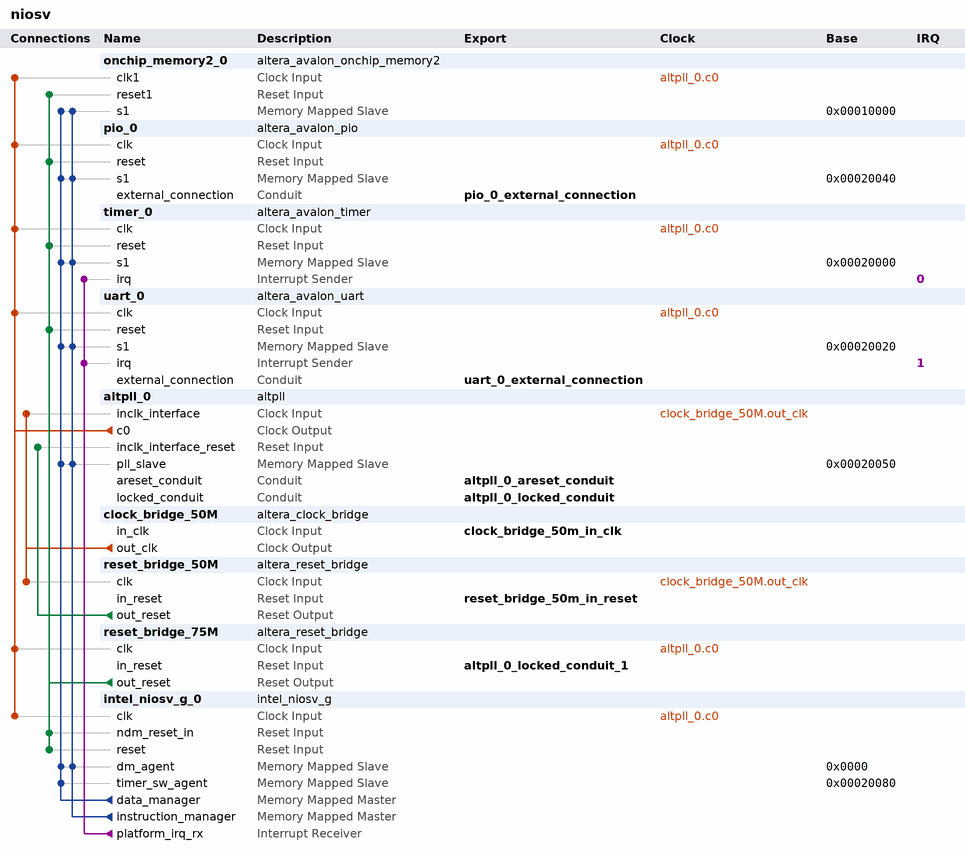
[diagram p0: system contents]
# Platform Designer (Qsys) system niosv, Cyclone 10 LP 10CL025YU256I7G
# Parameters at their usual value, and those the tool derives, are not listed.
package require -exact qsys 25.1
create_system niosv
set_project_property DEVICE_FAMILY {Cyclone 10 LP}
set_project_property DEVICE 10CL025YU256I7G

add_instance onchip_memory2_0 altera_avalon_onchip_memory2 25.1
set_instance_parameter_value onchip_memory2_0 dataWidth 32
set_instance_parameter_value onchip_memory2_0 dualPort false
set_instance_parameter_value onchip_memory2_0 initMemContent true
set_instance_parameter_value onchip_memory2_0 initializationFileName onchip_mem.hex
set_instance_parameter_value onchip_memory2_0 memorySize 38000
set_instance_parameter_value onchip_memory2_0 resetrequest_enabled false

add_instance pio_0 altera_avalon_pio 25.1
set_instance_parameter_value pio_0 direction Output
set_instance_parameter_value pio_0 width 4

add_instance timer_0 altera_avalon_timer 25.1
set_instance_parameter_value timer_0 period 100
set_instance_parameter_value timer_0 periodUnits MSEC

add_instance uart_0 altera_avalon_uart 25.1
set_instance_parameter_value uart_0 baud 115200
set_instance_parameter_value uart_0 dataBits 8
set_instance_parameter_value uart_0 fixedBaud true
set_instance_parameter_value uart_0 parity NONE
set_instance_parameter_value uart_0 stopBits 1

add_instance altpll_0 altpll 25.1
set_instance_parameter_value altpll_0 CLK0_DIVIDE_BY 2
set_instance_parameter_value altpll_0 CLK0_MULTIPLY_BY 3
set_instance_parameter_value altpll_0 CLK1_DIVIDE_BY 2
set_instance_parameter_value altpll_0 CLK1_DUTY_CYCLE 50
set_instance_parameter_value altpll_0 CLK1_MULTIPLY_BY 3
set_instance_parameter_value altpll_0 CLK1_PHASE_SHIFT 0
set_instance_parameter_value altpll_0 INCLK0_INPUT_FREQUENCY 20000
set_instance_parameter_value altpll_0 PORT_ARESET PORT_USED
set_instance_parameter_value altpll_0 PORT_LOCKED PORT_USED
set_instance_parameter_value altpll_0 PORT_clk1 PORT_USED
set_instance_parameter_value altpll_0 PORT_clk2 PORT_UNUSED
set_instance_parameter_value altpll_0 PORT_clk3 PORT_UNUSED

add_instance clock_bridge_50M altera_clock_bridge 25.1
set_instance_parameter_value clock_bridge_50M DERIVED_CLOCK_RATE 0
set_instance_parameter_value clock_bridge_50M EXPLICIT_CLOCK_RATE 50000000

add_instance reset_bridge_50M altera_reset_bridge 25.1
set_instance_parameter_value reset_bridge_50M ACTIVE_LOW_RESET 1
set_instance_parameter_value reset_bridge_50M SYNCHRONOUS_EDGES deassert

add_instance reset_bridge_75M altera_reset_bridge 25.1
set_instance_parameter_value reset_bridge_75M ACTIVE_LOW_RESET 1
set_instance_parameter_value reset_bridge_75M SYNCHRONOUS_EDGES deassert

add_instance intel_niosv_g_0 intel_niosv_g 4.0.0
set_instance_parameter_value intel_niosv_g_0 Blind_Window_Period 1000
set_instance_parameter_value intel_niosv_g_0 CLICenabledInterruptMode 0
set_instance_parameter_value intel_niosv_g_0 CLICenabledShadowRegisterFiles 1
set_instance_parameter_value intel_niosv_g_0 Default_Timeout_Period 255
set_instance_parameter_value intel_niosv_g_0 alignCLICVectorTable 8
set_instance_parameter_value intel_niosv_g_0 basicInterruptMode 0
set_instance_parameter_value intel_niosv_g_0 basicShadowRegisterFiles 0
set_instance_parameter_value intel_niosv_g_0 clockFrequency 75000000
set_instance_parameter_value intel_niosv_g_0 dataCacheSize 4096
set_instance_parameter_value intel_niosv_g_0 disableFsqrtFdiv false
set_instance_parameter_value intel_niosv_g_0 dtcm1Base 0
set_instance_parameter_value intel_niosv_g_0 dtcm1Size 0
set_instance_parameter_value intel_niosv_g_0 dtcm2Base 0
set_instance_parameter_value intel_niosv_g_0 dtcm2Size 0
set_instance_parameter_value intel_niosv_g_0 enableBranchPrediction true
set_instance_parameter_value intel_niosv_g_0 enableCLICInterruptEdgeTriggerConfig false
set_instance_parameter_value intel_niosv_g_0 enableCLICInterruptPolarityConfig false
set_instance_parameter_value intel_niosv_g_0 enableCLICSelectiveHardwareVectoring false
set_instance_parameter_value intel_niosv_g_0 enableCoreLevelInterruptController false
set_instance_parameter_value intel_niosv_g_0 enableDebug true
set_instance_parameter_value intel_niosv_g_0 enableDebugReset true
set_instance_parameter_value intel_niosv_g_0 enableECCFull false
set_instance_parameter_value intel_niosv_g_0 enableECCLite false
set_instance_parameter_value intel_niosv_g_0 enableFPU false
set_instance_parameter_value intel_niosv_g_0 enableLockstep false
set_instance_parameter_value intel_niosv_g_0 enableLockstepExtRst false
set_instance_parameter_value intel_niosv_g_0 enableMulDiv true
set_instance_parameter_value intel_niosv_g_0 hartId 0
set_instance_parameter_value intel_niosv_g_0 instCacheSize 4096
set_instance_parameter_value intel_niosv_g_0 itcm1Base 0
set_instance_parameter_value intel_niosv_g_0 itcm1Size 0
set_instance_parameter_value intel_niosv_g_0 itcm2Base 0
set_instance_parameter_value intel_niosv_g_0 itcm2Size 0
set_instance_parameter_value intel_niosv_g_0 numCLICDebugTriggers 0
set_instance_parameter_value intel_niosv_g_0 numCLICLevels 2
set_instance_parameter_value intel_niosv_g_0 numCLICPlatformInterrupts 16
set_instance_parameter_value intel_niosv_g_0 numCLICPriorities 8
set_instance_parameter_value intel_niosv_g_0 peripheralRegionABase 131072
set_instance_parameter_value intel_niosv_g_0 peripheralRegionASize 65536
set_instance_parameter_value intel_niosv_g_0 peripheralRegionBBase 0
set_instance_parameter_value intel_niosv_g_0 peripheralRegionBSize 0
set_instance_parameter_value intel_niosv_g_0 resetOffset 0
set_instance_parameter_value intel_niosv_g_0 resetSlave onchip_memory2_0.s1
set_instance_parameter_value intel_niosv_g_0 useResetReq false

# connections
add_connection altpll_0.c0 intel_niosv_g_0.clk clock
add_connection altpll_0.c0 onchip_memory2_0.clk1 clock
add_connection altpll_0.c0 pio_0.clk clock
add_connection altpll_0.c0 reset_bridge_75M.clk clock
add_connection altpll_0.c0 timer_0.clk clock
add_connection altpll_0.c0 uart_0.clk clock
add_connection clock_bridge_50M.out_clk altpll_0.inclk_interface clock
add_connection clock_bridge_50M.out_clk reset_bridge_50M.clk clock
add_connection reset_bridge_50M.out_reset altpll_0.inclk_interface_reset reset
add_connection reset_bridge_75M.out_reset intel_niosv_g_0.ndm_reset_in reset
add_connection reset_bridge_75M.out_reset intel_niosv_g_0.reset reset
add_connection reset_bridge_75M.out_reset onchip_memory2_0.reset1 reset
add_connection reset_bridge_75M.out_reset pio_0.reset reset
add_connection reset_bridge_75M.out_reset timer_0.reset reset
add_connection reset_bridge_75M.out_reset uart_0.reset reset
add_connection intel_niosv_g_0.data_manager altpll_0.pll_slave avalon
set_connection_parameter_value intel_niosv_g_0.data_manager/altpll_0.pll_slave baseAddress 0x00020050
add_connection intel_niosv_g_0.data_manager intel_niosv_g_0.dm_agent avalon
set_connection_parameter_value intel_niosv_g_0.data_manager/intel_niosv_g_0.dm_agent baseAddress 0x0000
add_connection intel_niosv_g_0.data_manager intel_niosv_g_0.timer_sw_agent avalon
set_connection_parameter_value intel_niosv_g_0.data_manager/intel_niosv_g_0.timer_sw_agent baseAddress 0x00020080
add_connection intel_niosv_g_0.data_manager onchip_memory2_0.s1 avalon
set_connection_parameter_value intel_niosv_g_0.data_manager/onchip_memory2_0.s1 baseAddress 0x00010000
add_connection intel_niosv_g_0.data_manager pio_0.s1 avalon
set_connection_parameter_value intel_niosv_g_0.data_manager/pio_0.s1 baseAddress 0x00020040
add_connection intel_niosv_g_0.data_manager timer_0.s1 avalon
set_connection_parameter_value intel_niosv_g_0.data_manager/timer_0.s1 baseAddress 0x00020000
add_connection intel_niosv_g_0.data_manager uart_0.s1 avalon
set_connection_parameter_value intel_niosv_g_0.data_manager/uart_0.s1 baseAddress 0x00020020
add_connection intel_niosv_g_0.instruction_manager altpll_0.pll_slave avalon
set_connection_parameter_value intel_niosv_g_0.instruction_manager/altpll_0.pll_slave baseAddress 0x00020050
add_connection intel_niosv_g_0.instruction_manager intel_niosv_g_0.dm_agent avalon
set_connection_parameter_value intel_niosv_g_0.instruction_manager/intel_niosv_g_0.dm_agent baseAddress 0x0000
add_connection intel_niosv_g_0.instruction_manager onchip_memory2_0.s1 avalon
set_connection_parameter_value intel_niosv_g_0.instruction_manager/onchip_memory2_0.s1 baseAddress 0x00010000
add_connection intel_niosv_g_0.instruction_manager pio_0.s1 avalon
set_connection_parameter_value intel_niosv_g_0.instruction_manager/pio_0.s1 baseAddress 0x00020040
add_connection intel_niosv_g_0.instruction_manager timer_0.s1 avalon
set_connection_parameter_value intel_niosv_g_0.instruction_manager/timer_0.s1 baseAddress 0x00020000
add_connection intel_niosv_g_0.instruction_manager uart_0.s1 avalon
set_connection_parameter_value intel_niosv_g_0.instruction_manager/uart_0.s1 baseAddress 0x00020020
add_connection intel_niosv_g_0.platform_irq_rx timer_0.irq interrupt
set_connection_parameter_value intel_niosv_g_0.platform_irq_rx/timer_0.irq irqNumber 0
add_connection intel_niosv_g_0.platform_irq_rx uart_0.irq interrupt
set_connection_parameter_value intel_niosv_g_0.platform_irq_rx/uart_0.irq irqNumber 1

# exported interfaces
add_interface altpll_0_areset_conduit conduit end
set_interface_property altpll_0_areset_conduit EXPORT_OF altpll_0.areset_conduit
add_interface altpll_0_locked_conduit conduit end
set_interface_property altpll_0_locked_conduit EXPORT_OF altpll_0.locked_conduit
add_interface altpll_0_locked_conduit_1 reset sink
set_interface_property altpll_0_locked_conduit_1 EXPORT_OF reset_bridge_75M.in_reset
add_interface clock_bridge_50m_in_clk clock sink
set_interface_property clock_bridge_50m_in_clk EXPORT_OF clock_bridge_50M.in_clk
add_interface pio_0_external_connection conduit end
set_interface_property pio_0_external_connection EXPORT_OF pio_0.external_connection
add_interface reset_bridge_50m_in_reset reset sink
set_interface_property reset_bridge_50m_in_reset EXPORT_OF reset_bridge_50M.in_reset
add_interface uart_0_external_connection conduit end
set_interface_property uart_0_external_connection EXPORT_OF uart_0.external_connection

set_interconnect_requirement {$system} qsys_mm.clockCrossingAdapter HANDSHAKE
set_interconnect_requirement {$system} qsys_mm.enableEccProtection FALSE
set_interconnect_requirement {$system} qsys_mm.insertDefaultSlave FALSE
set_interconnect_requirement {$system} qsys_mm.maxAdditionalLatency 1

save_system niosv.qsys
